# Altium schematic sheet Filter-Section.SchDoc
size A4; SheetNumber: 8; SheetTotal: 11
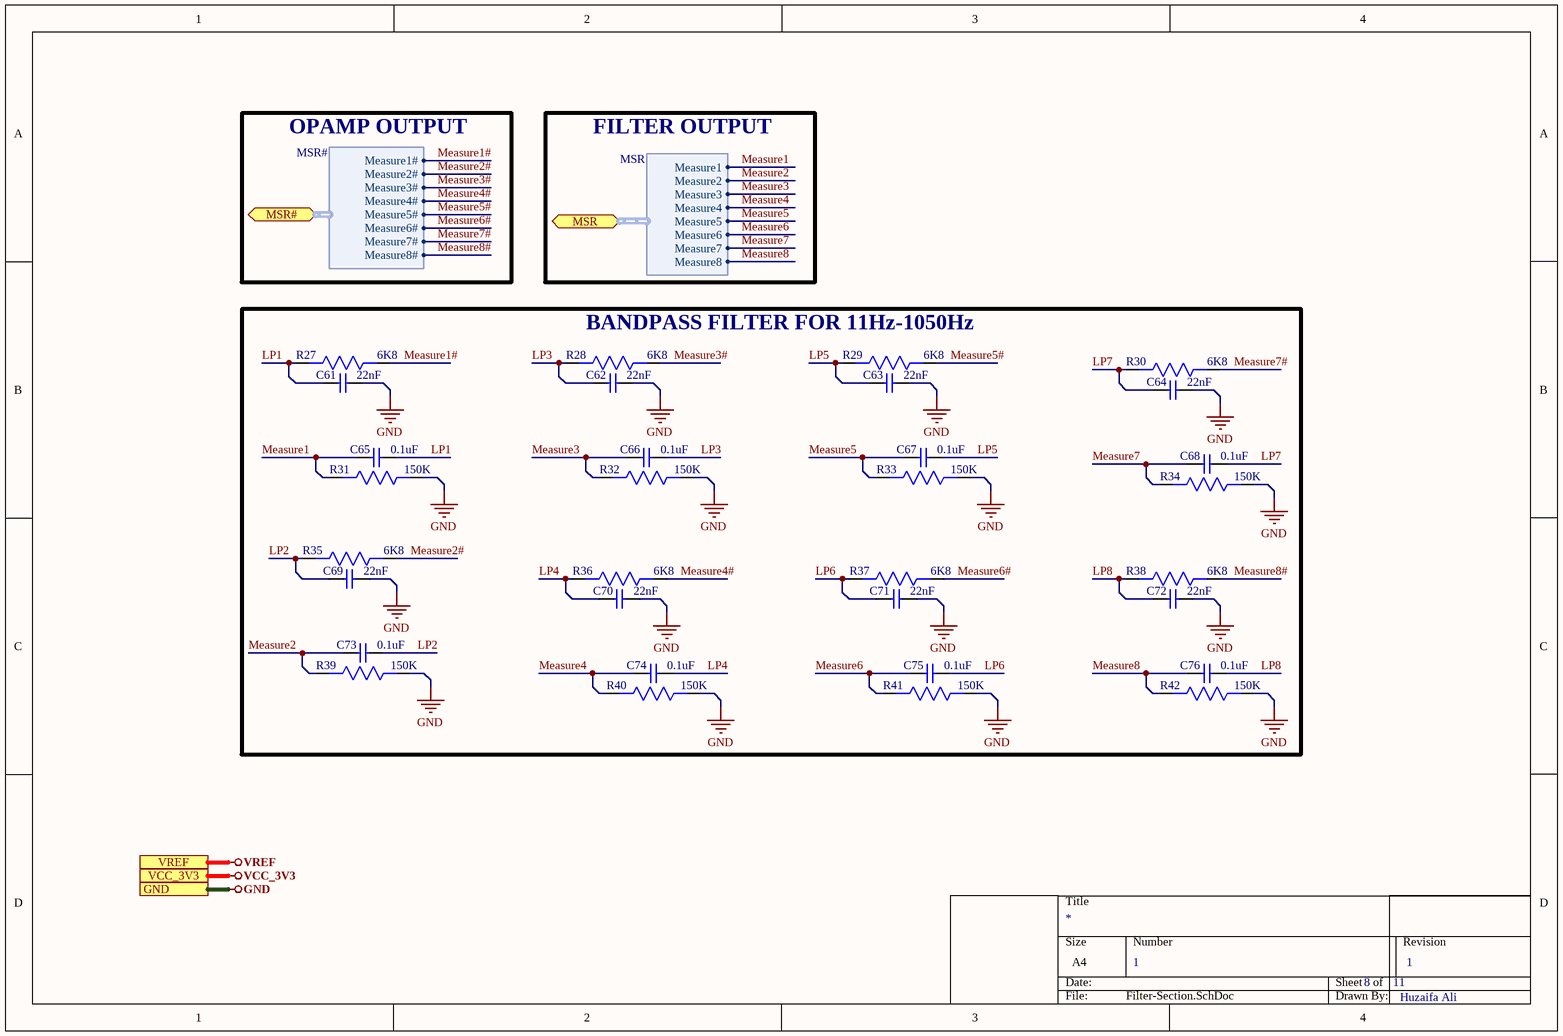
[diagram p0: Filter-Section.SchDoc]

## Parts
C61  22nF  [Cap 0402]
C62  22nF  [Cap 0402]
C63  22nF  [Cap 0402]
C64  22nF  [Cap 0402]
C65  0.1uF  [Cap 0402]
C66  0.1uF  [Cap 0402]
C67  0.1uF  [Cap 0402]
C68  0.1uF  [Cap 0402]
C69  22nF  [Cap 0402]
C70  22nF  [Cap 0402]
C71  22nF  [Cap 0402]
C72  22nF  [Cap 0402]
C73  0.1uF  [Cap 0402]
C74  0.1uF  [Cap 0402]
C75  0.1uF  [Cap 0402]
C76  0.1uF  [Cap 0402]
R27  6K8  [Res0402]
R28  6K8  [Res0402]
R29  6K8  [Res0402]
R30  6K8  [Res0402]
R31  150K  [Res0402]
R32  150K  [Res0402]
R33  150K  [Res0402]
R34  150K  [Res0402]
R35  6K8  [Res0402]
R36  6K8  [Res0402]
R37  6K8  [Res0402]
R38  6K8  [Res0402]
R39  150K  [Res0402]
R40  150K  [Res0402]
R41  150K  [Res0402]
R42  150K  [Res0402]

## Blocks framed on the sheet
BANDPASS FILTER FOR 11Hz-1050Hz: C61-C76 R27-R42

## Ports
GND, MSR (bidir, harness MSR), MSR# (bidir, harness MSR#), VCC_3V3, VREF

## Harnesses
MSR: Measure1, Measure2, Measure3, Measure4, Measure5, Measure6, Measure7, Measure8
MSR#: Measure1#, Measure2#, Measure3#, Measure4#, Measure5#, Measure6#, Measure7#, Measure8#

## Nets
GND: C61.2 C62.2 C63.2 C64.2 C69.2 C70.2 C71.2 C72.2 R31.1 R32.1 R33.1 R34.1 R39.1 R40.1 R41.1 R42.1 ; port GND
VCC_3V3: port VCC_3V3
VREF: port VREF
LP1: C61.1 C65.2 R27.2
LP2: C69.1 C73.2 R35.2
LP3: C62.1 C66.2 R28.2
LP4: C70.1 C74.2 R36.2
LP5: C63.1 C67.2 R29.2
LP6: C71.1 C75.2 R37.2
LP7: C64.1 C68.2 R30.2
LP8: C72.1 C76.2 R38.2
Measure1: C65.1 R31.2 ; port MSR.Measure1
Measure1#: R27.1 ; port MSR#.Measure1#
Measure2: C73.1 R39.2 ; port MSR.Measure2
Measure2#: R35.1 ; port MSR#.Measure2#
Measure3: C66.1 R32.2 ; port MSR.Measure3
Measure3#: R28.1 ; port MSR#.Measure3#
Measure4: C74.1 R40.2 ; port MSR.Measure4
Measure4#: R36.1 ; port MSR#.Measure4#
Measure5: C67.1 R33.2 ; port MSR.Measure5
Measure5#: R29.1 ; port MSR#.Measure5#
Measure6: C75.1 R41.2 ; port MSR.Measure6
Measure6#: R37.1 ; port MSR#.Measure6#
Measure7: C68.1 R34.2 ; port MSR.Measure7
Measure7#: R30.1 ; port MSR#.Measure7#
Measure8: C76.1 R42.2 ; port MSR.Measure8
Measure8#: R38.1 ; port MSR#.Measure8#

## Notes on the sheet
- OPAMP OUTPUT
- FILTER OUTPUT
- 1
- Huzaifa Ali

## Library data of the parts
C61-C64 C69-C72 = CGA2B2X7R1E223KT0Y0F: Cap Ceramic 0.022uF 25V X7R 10% Pad SMD 0402; Manufacturer: TDK; Manufacturer Part Number: CGA2B2X7R1E223K050BA; Supplier 1: RSComponents; RoHS: Yes; Category: Ceramic Capacitors; Stock 1: 15000; Pricing 1: 500=0.01900, 5000=0.01200 (USD); Mount: Surface Mount; Case/Package: 0402; Case Code (Imperial): 0402; Case Code (Metric): 1005; Weight: 2.3E-05oz; Min Operating Temperature: -55°C; Max Operating Temperature: 125°C; Capacitance: 22nF; Voltage Rating (DC): 25V; Tolerance: 10%; Packaging: Tape and Reel; Package Quantity: 1; Voltage Rating: 25V; Dielectric: X7R; Termination: SMD/SMT; Resistor Type: Ceramic; Series: CGA; Length: 1mm; Width: 0.5mm; Height: 0.5mm; Thickness: 0.022inch; Depth: 0.5mm; Ratings: AEC-Q200; REACH SVHC: No SVHC; RoHS Compliant: Yes; ComponentLink1URL: https://datasheet.ciiva.com/24220/cga2b2x7r1e223k050ba-265693-24220032.pdf?src-supplier=Mouser; ComponentLink1Description: https://datasheet.ciiva.com/24220/cga2b2x7r1e223k050ba-265693-24220032.pdf?src-supplier=Mouser; Supplier Part Number 1: 9155588
C65-C68 C73-C76 = GRM155R71H104ME14D: CAP CER 0.1UF 50V X7R 0402; Manufacturer: Murata; Tolerance: 20%; Capacitance: 100nF; Supplier 1: Digi-Key; Manufacturer Part Number: GRM155R71H104ME14D; Stock 1: 439844; Pricing 1: 1=0.1, 10=0.038, 100=0.0168, 500=0.01198, 1000=0.00941, 2500=0.00855, 5000=0.00787 (USD); Mount: Surface Mount; Case/Package: 0402; Min Operating Temperature: -55°C; Max Operating Temperature: 125°C; Packaging: Cut Tape; Voltage Rating: 50V; Length: 0.039inch; Width: 0.02inch; Thickness: 0.022inch; ComponentLink1URL: http://search.murata.co.jp/Ceramy/image/img/A01X/G101/ENG/GRM155R71H104ME14-01.pdf?src-supplier=Digi-Key; ComponentLink1Description: http://search.murata.co.jp/Ceramy/image/img/A01X/G101/ENG/GRM155R71H104ME14-01.pdf?src-supplier=Digi-Key; ComponentLink2URL: http://psearch.en.murata.com/capacitor/product/GRM155R71H104ME14%23.pdf?src-supplier=Avnet; ComponentLink2Description: http://psearch.en.murata.com/capacitor/product/GRM155R71H104ME14%23.pdf?src-supplier=Avnet; ComponentLink3URL: http://components.arrow.com/part/dataview/0323_07177683?src-supplier=Arrow+Europe; ComponentLink3Description: http://components.arrow.com/part/dataview/0323_07177683?src-supplier=Arrow+Europe; ComponentLink4URL: http://www.mouser.com/ds/2/281/c02e-2905.pdf?src-supplier=Mouser; ComponentLink4Description: http://www.mouser.com/ds/2/281/c02e-2905.pdf?src-supplier=Mouser; Supplier Part Number 1: 490-10701-1-ND
R27-R30 R35-R38 = RC0402JR-076K8L: Res Thick Film 0402 6.8K Ohm 5% 0.063W(1/16W) ±100ppm/C Pad SMD T/R; Manufacturer: Yageo; Resistance: 6.8kR; Power Rating: 63mW; Voltage Rating: 50V; Temperature Coefficient: 100ppm/°C; Supplier 1: Arrow Electronics; Manufacturer Part Number: RC0402JR-076K8L; RoHS: Yes; Category: Chip SMD Resistors; Stock 1: 10110; Pricing 1: 1=0.08660, 10=0.01760, 25=0.01340, 100=0.00570, 500=0.00400, 1000=0.00230, 3000=0.00200, 6000=0.00170 (USD); Case/Package: 0402; Number of Pins: 2; Case Code (Metric): 1005; Case Code (Imperial): 0402; Weight: 2.3E-05oz; Min Operating Temperature: -55°C; Max Operating Temperature: 155°C; Package Quantity: 1; Tolerance: 5%; Packaging: Tape and Reel; Voltage Rating (DC): 50V; Resistor Type: Thick Film; Number of Terminations: 2; Termination: SMD/SMT; Max Power Dissipation: 63mW; Working Voltage: 50V; Features: Moisture Resistant; Series: RC; Technology: THICK FILM; Resistance Tolerance: 5%; Construction: Rectangular; Length: 1mm; Width: 0.5mm; Height: 0.016inch; Depth: 0.5mm; REACH SVHC: No SVHC; Military Standard: Not; Lead Free: Lead Free; RoHS Compliant: Yes; ComponentLink1URL: https://datasheet.ciiva.com/22643/1018594-22643413.pdf?src-supplier=Element14; ComponentLink1Description: https://datasheet.ciiva.com/22643/1018594-22643413.pdf?src-supplier=Element14; ComponentLink2URL: https://datasheet.ciiva.com/2452/pyu-r-int-thick-7-2452783.pdf?src-supplier=Digi-Key; ComponentLink2Description: https://datasheet.ciiva.com/2452/pyu-r-int-thick-7-2452783.pdf?src-supplier=Digi-Key; ComponentLink3URL: https://datasheet.ciiva.com/2452/pyu-r-int-thick-7-2452784.pdf?src-supplier=Digi-Key; ComponentLink3Description: https://datasheet.ciiva.com/2452/pyu-r-int-thick-7-2452784.pdf?src-supplier=Digi-Key; ComponentLink4URL: https://datasheet.ciiva.com/2452/pyu-r-int-thick-7-2452782.pdf?src-supplier=Digi-Key; ComponentLink4Description: https://datasheet.ciiva.com/2452/pyu-r-int-thick-7-2452782.pdf?src-supplier=Digi-Key; ComponentLink5URL: https://datasheet.ciiva.com/6067/1018594-6067880.pdf?src-supplier=Farnell; ComponentLink5Description: https://datasheet.ciiva.com/6067/1018594-6067880.pdf?src-supplier=Farnell; ComponentLink6URL: https://datasheet.ciiva.com/15189/getdatasheetpartid-326392-15189579.pdf?src-supplier=Verical; ComponentLink6Description: https://datasheet.ciiva.com/15189/getdatasheetpartid-326392-15189579.pdf?src-supplier=Verical; Supplier Part Number 1: RC0402JR-076K8L
R31-R34 R39-R42 = RC0402JR-07150KL: RES SMD 0402 150kOhm 5% Paper T/R; Manufacturer: Yageo; Resistance: 150kR; Power Rating: 63mW; Voltage Rating: 50V; Temperature Coefficient: 100ppm/°C; Supplier 1: Arrow Electronics; Manufacturer Part Number: RC0402JR-07150KL; RoHS: Yes; Category: Chip SMD Resistors; Stock 1: 170000; Pricing 1: 10000=0.00100 (USD); Case/Package: 0402; Case Code (Metric): 1005; Case Code (Imperial): 0402; Weight: 2.3E-05oz; Size Code: 0402; Min Operating Temperature: -55°C; Max Operating Temperature: 155°C; Package Quantity: 1; Tolerance: 5%; Packaging: Tape and Reel; Resistor Type: Thick Film; Number of Terminations: 2; Termination: SMD/SMT; Max Power Dissipation: 63mW; Features: Moisture Resistant; Series: RC; Construction: Rectangular; Resistance Tolerance: 5%; Length: 1mm; Width: 0.02inch; Height: 0.016inch; Depth: 0.5mm; REACH SVHC: No SVHC; Military Standard: Not; Lead Free: Lead Free; RoHS Compliant: Yes; ComponentLink1URL: https://datasheet.ciiva.com/7983/1018594-7983551.pdf?src-supplier=Element14; ComponentLink1Description: https://datasheet.ciiva.com/7983/1018594-7983551.pdf?src-supplier=Element14; ComponentLink2URL: https://datasheet.ciiva.com/2518/pyu-r-int-thick-7-2518929.pdf?src-supplier=Digi-Key; ComponentLink2Description: https://datasheet.ciiva.com/2518/pyu-r-int-thick-7-2518929.pdf?src-supplier=Digi-Key; ComponentLink3URL: https://datasheet.ciiva.com/2518/pyu-r-int-thick-7-2518930.pdf?src-supplier=Digi-Key; ComponentLink3Description: https://datasheet.ciiva.com/2518/pyu-r-int-thick-7-2518930.pdf?src-supplier=Digi-Key; ComponentLink4URL: https://datasheet.ciiva.com/2518/pyu-r-int-thick-7-2518928.pdf?src-supplier=Digi-Key; ComponentLink4Description: https://datasheet.ciiva.com/2518/pyu-r-int-thick-7-2518928.pdf?src-supplier=Digi-Key; ComponentLink5URL: https://datasheet.ciiva.com/7850/1018594-7850149.pdf?src-supplier=Element14; ComponentLink5Description: https://datasheet.ciiva.com/7850/1018594-7850149.pdf?src-supplier=Element14; ComponentLink6URL: https://datasheet.ciiva.com/17072/pyu-rc0402-51-rohs-l-6-r-17072379.pdf?src-supplier=Future+Electronics; ComponentLink6Description: https://datasheet.ciiva.com/17072/pyu-rc0402-51-rohs-l-6-r-17072379.pdf?src-supplier=Future+Electronics; ComponentLink7URL: https://datasheet.ciiva.com/15189/getdatasheetpartid-251830-15189543.pdf?src-supplier=Verical; ComponentLink7Description: https://datasheet.ciiva.com/15189/getdatasheetpartid-251830-15189543.pdf?src-supplier=Verical; Supplier Part Number 1: RC0402JR-07150KL